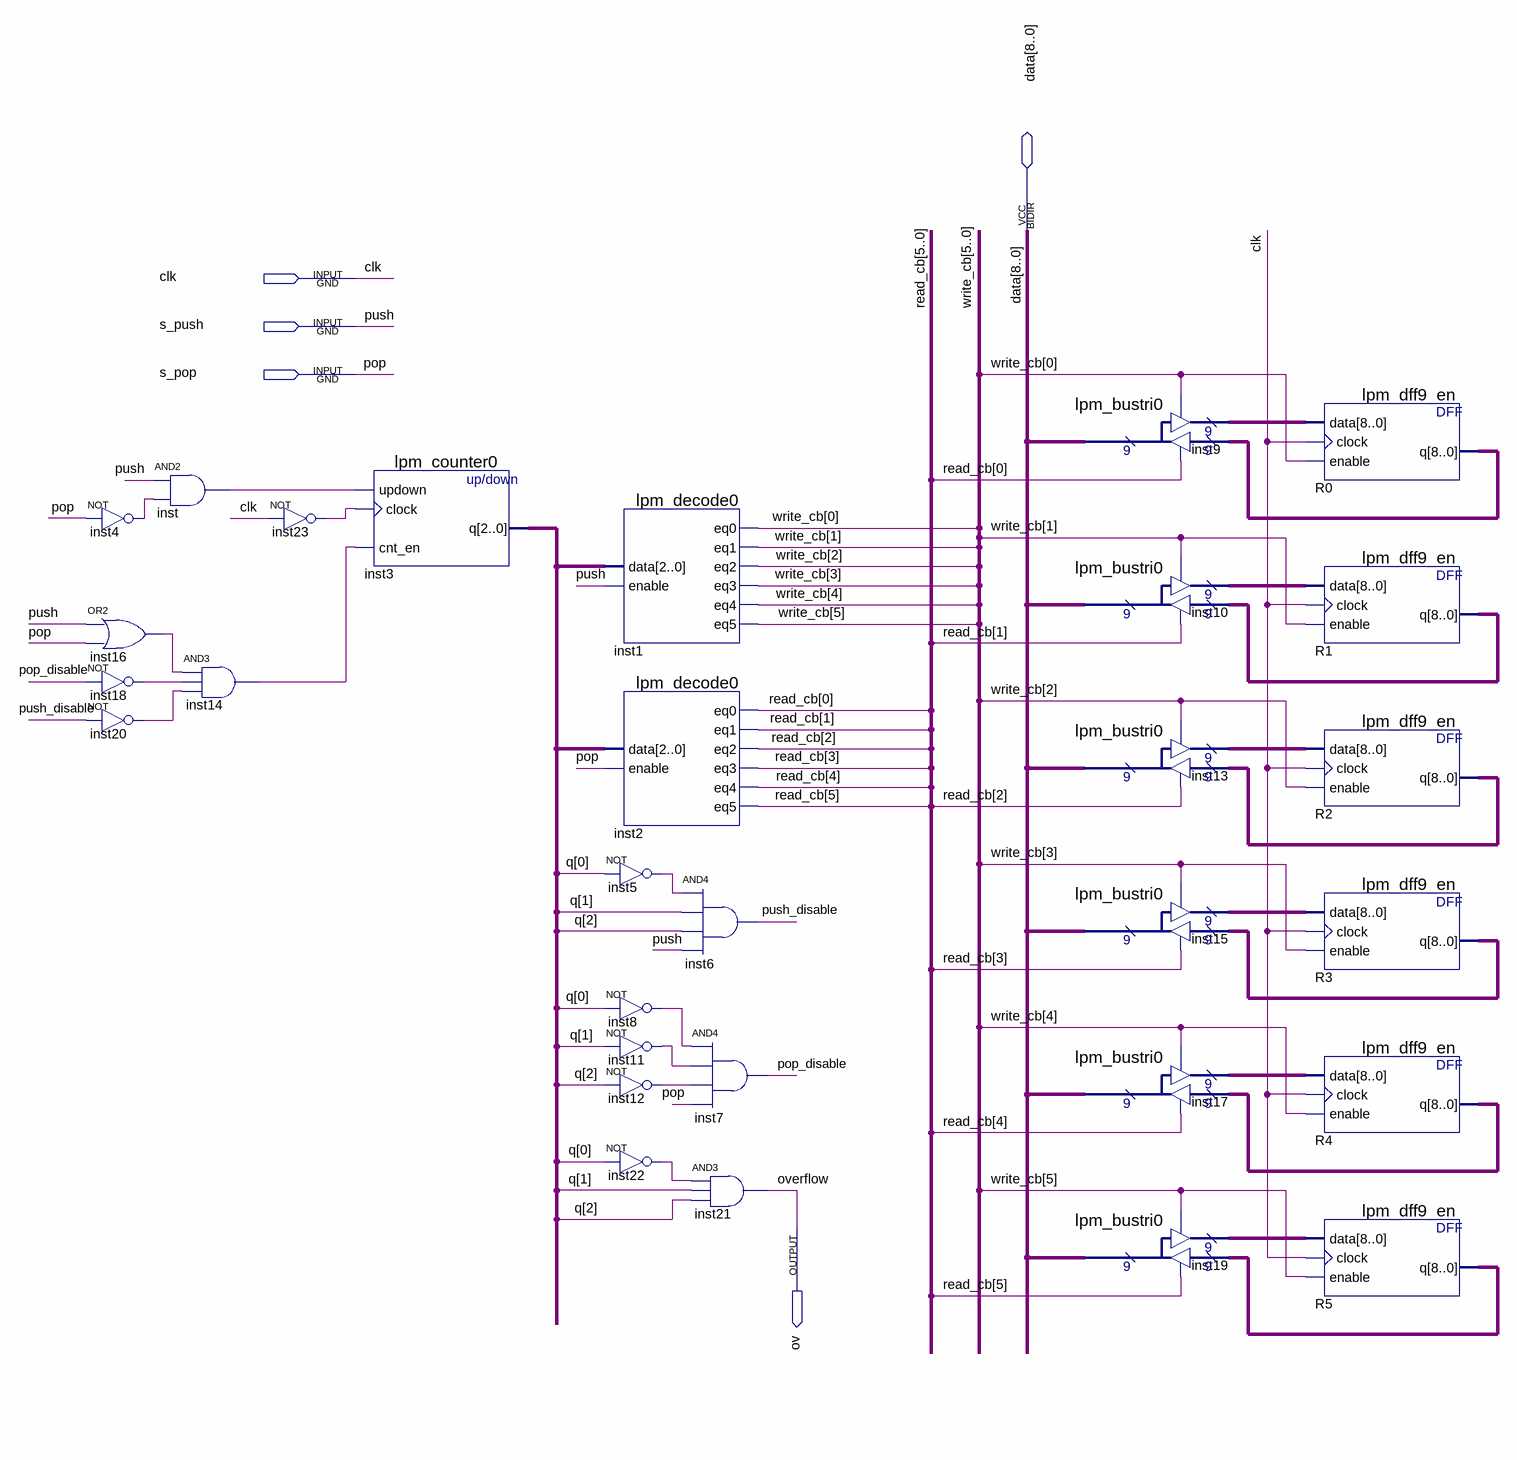
[diagram p0: schematic sheet]
// Quartus schematic stack.bdf as structural Verilog: 30 symbols, 5 pins
module stack (
  input  clk,
  input  s_push,
  input  s_pop,
  inout  [8:0] data,
  output ov
);

  wire inst4_out, inst5_out, inst8_out, inst11_out, inst12_out, inst14_out, inst16_out, inst18_out,
       inst20_out, inst22_out, inst23_out, inst_out, pop_disable, push_disable;
  wire [2:0] inst3_q, q;
  wire [5:0] read_cb, write_cb;
  wire [8:0] inst9_result, inst10_result, inst13_result, inst15_result, inst17_result, inst19_result, R0_q,
       R1_q, R2_q, R3_q, R4_q, R5_q;

  not inst4 (inst4_out, s_pop);
  or inst16 (inst16_out, s_push, s_pop);
  not inst18 (inst18_out, pop_disable);
  not inst20 (inst20_out, push_disable);
  and inst (inst_out, s_push, inst4_out);
  and inst14 (inst14_out, inst16_out, inst18_out, inst20_out);
  not inst23 (inst23_out, clk);
  lpm_counter0 inst3 (.updown(inst_out), .clock(inst23_out), .cnt_en(inst14_out), .q(inst3_q));
  lpm_decode0 inst1 (
    .data(inst3_q), .enable(s_push), .eq0(write_cb[0]), .eq1(write_cb[1]), .eq2(write_cb[2]),
    .eq3(write_cb[3]), .eq4(write_cb[4]), .eq5(write_cb[5]));
  lpm_decode0 inst2 (
    .data(inst3_q), .enable(s_pop), .eq0(read_cb[0]), .eq1(read_cb[1]), .eq2(read_cb[2]), .eq3(read_cb[3]),
    .eq4(read_cb[4]), .eq5(read_cb[5]));
  not inst5 (inst5_out, q[0]);
  not inst8 (inst8_out, q[0]);
  not inst11 (inst11_out, q[1]);
  not inst12 (inst12_out, q[2]);
  not inst22 (inst22_out, q[0]);
  and inst6 (push_disable, inst5_out, q[1], q[2], s_push);
  and inst7 (pop_disable, inst8_out, inst11_out, inst12_out, s_pop);
  and inst21 (ov, inst22_out, q[1], q[2]);
  lpm_bustri0 inst9 (.enabledt(read_cb[0]), .data(R0_q), .enabletr(write_cb[0]), .result(inst9_result), .tridata(data));
  lpm_bustri0 inst10 (
    .enabledt(read_cb[1]), .data(R1_q), .enabletr(write_cb[1]), .result(inst10_result), .tridata(data));
  lpm_bustri0 inst13 (
    .enabledt(read_cb[2]), .data(R2_q), .enabletr(write_cb[2]), .result(inst13_result), .tridata(data));
  lpm_bustri0 inst15 (
    .enabledt(read_cb[3]), .data(R3_q), .enabletr(write_cb[3]), .result(inst15_result), .tridata(data));
  lpm_bustri0 inst17 (
    .enabledt(read_cb[4]), .data(R4_q), .enabletr(write_cb[4]), .result(inst17_result), .tridata(data));
  lpm_bustri0 inst19 (
    .enabledt(read_cb[5]), .data(R5_q), .enabletr(write_cb[5]), .result(inst19_result), .tridata(data));
  lpm_dff9_en R0 (.data(inst9_result), .clock(clk), .enable(write_cb[0]), .q(R0_q));
  lpm_dff9_en R1 (.data(inst10_result), .clock(clk), .enable(write_cb[1]), .q(R1_q));
  lpm_dff9_en R2 (.data(inst13_result), .clock(clk), .enable(write_cb[2]), .q(R2_q));
  lpm_dff9_en R3 (.data(inst15_result), .clock(clk), .enable(write_cb[3]), .q(R3_q));
  lpm_dff9_en R4 (.data(inst17_result), .clock(clk), .enable(write_cb[4]), .q(R4_q));
  lpm_dff9_en R5 (.data(inst19_result), .clock(clk), .enable(write_cb[5]), .q(R5_q));

  // Other names for the same wires on the sheet: overflow = ov; pop = s_pop; push = s_push
endmodule
